# EasyEDA Pro project 辅助电源.epro, board 3V3/5V
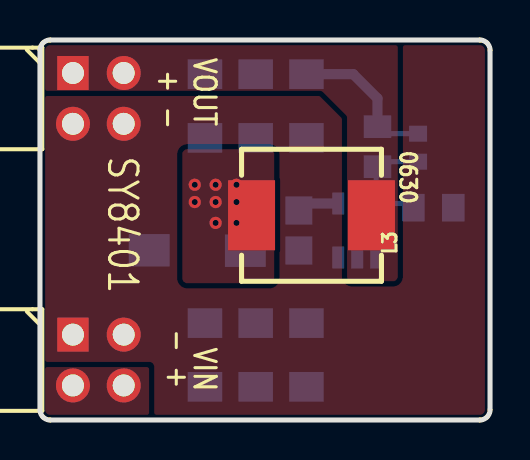
[diagram p11: board, top side]
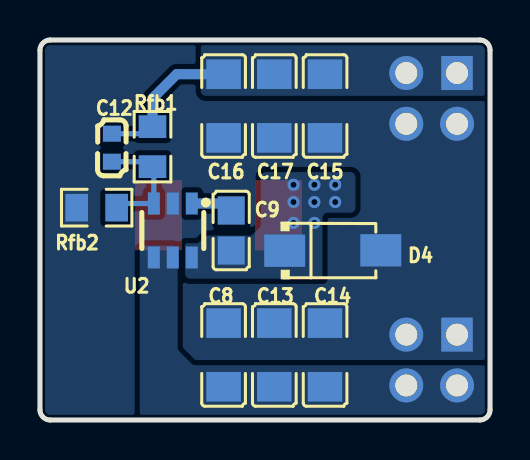
[diagram p12: board, bottom side, seen from below]

Outline 22.52 x 19 mm; copper layers: Top Layer, Bottom Layer. Coordinates in mm from the lower left corner of the outline.
Outline path: 0,18.49 0,0.51 arc(0.15,0.15) 0.51,0 22.01,0 arc(22.37,0.15) 22.52,0.51 22.52,18.49 arc(22.37,18.85) 22.01,19 0.51,19 arc(0.15,18.85) 0,18.49
Stack: Top Layer 0.035mm / Dielectric1 1.51mm FR4 er 4.5 / Bottom Layer 0.035mm

## Design rules (mm)
spacing copperThickness1oz (default): track to track 0.102, other pairs 0.152 to 0.3
spacing copperThickness2oz: track to track 0.203, other pairs 0.152 to 0.3
spacing Plane_innerPlane: track to track 0.102, other pairs 0.152 to 0.3
spacing Copper_copperRegion: track to track 0.102, other pairs 0.152 to 0.3
track width copperThickness1oz (default): min 0.127, default 0.254, max 2.54
track width copperThickness2oz: min 0.203, default 0.254, max 2.54
differential pair differentialPair (default): width min 0.127, default 0.254, max 2.54; gap min 0.152, default 0.152
pour e23 uses Copper_copperRegion
pour e25 uses Copper_copperRegion
pour e27 uses Copper_copperRegion
pour e29 uses Copper_copperRegion
pour e31 uses Copper_copperRegion
pour e33 uses Copper_copperRegion
pour e35 uses Copper_copperRegion
pour e37 uses Copper_copperRegion

## Placement (name value [footprint] x y rotation side)
C8  100nF  [C1206]  13.34 3.25 270 bottom
C9  100nF  [C0805]  12.95 9.47 90 bottom
C12  22pF  [C0603]  18.92 13.61 90 bottom
C13  10uF  [C1206]  10.79 3.25 270 bottom
C14  47uF  [C1206]  8.25 3.25 270 bottom
C15  100nF  [C1206]  8.25 15.7 90 bottom
C16  10uF  [C1206]  13.34 15.7 90 bottom
C17  10uF  [C1206]  10.79 15.7 90 bottom
D4  SS510  [SMA_L4.3-W2.6-LS5.0-RD]  7.87 8.47 180 bottom
J1  HX PZ2.54-2x2P WC-A  [HDR-TH_4P-P2.54-H-M-R2-C2-S2.54-W10.0]  2.92 3 270 top
J2  HX PZ2.54-2x2P WC-A  [HDR-TH_4P-P2.54-H-M-R2-C2-S2.54-W10.0]  2.92 16.08 270 top
L3  10uH  [IND-SMD_L7.3-W6.8]  13.59 10.24 0 top
Rfb1  220K  [R0805]  16.89 13.67 90 bottom
Rfb2  30K  [R0805]  19.69 10.62 180 bottom
U2  SY8401ABC  [SOT-23-6_L2.9-W1.6-P0.95-LS2.8-BR]  15.88 9.47 90 bottom

## Footprints (pads in the part's own frame, mm; a bottom-side part is the same pattern mirrored in y, then rotated)
C0603
  rect 0.8x0.9 smd: 1(-0.7,0) 2(0.7,0)
C0805
  rect 1.41x1.35 smd: 1(-1,0) 2(1,0)
C1206
  rect 1.485x1.728 smd: 1(-1.593,0) 2(1.593,0)
HDR-TH_4P-P2.54-H-M-R2-C2-S2.54-W10.0
  rect 1.7x1.575 hole 1.1: 1(-1.27,-1.27)
  round 1.7 hole 1.1: 2(-1.27,1.27) 3(1.27,-1.27) 4(1.27,1.27)
IND-SMD_L7.3-W6.8
  rect 2.35x3.5 smd: 1(-3,0) 2(3,0)
R0805
  rect 1.133x1.377 smd: 1(-1,0) 2(1,0)
SMA_L4.3-W2.6-LS5.0-RD
  rect 2.046x1.62 smd: 1(-2.404,-0.009) 2(2.404,0.009)
SOT-23-6_L2.9-W1.6-P0.95-LS2.8-BR
  rect 1.1x0.6 smd: 1(1.35,-0.95) 2(1.35,0) 3(1.35,0.95) 4(-1.35,0.95) 5(-1.35,0) 6(-1.35,-0.95)

## Nets
As in the schematic.

## Via types
v1: diameter 0.61, hole 0.305, Top Layer to Bottom Layer, 8 vias

## Routing (per net, layer and track width the routed paths; a pad name or vN(x,y) marks a point on that pad's centre or on a via; arc(x,y) is an arc through that point)
VOUT: length 7.6
  Bottom Layer w0.254: Rfb1.2 17.24,14.31 C12.2
  Bottom Layer w0.508: C16.2 15.68,17.29 16.89,16.08 Rfb1.2
$1N562: length 5.9
  Bottom Layer w0.254: C12.1 17.14,12.91 Rfb1.1 16.82,12.6 U2.3 18.48,10.82 Rfb2.2
$1N567: length 2.1
  Bottom Layer w0.508: U2.1 13.3,10.82 C9.2
$1N1221:
  vias: v1(7.75,11.76) v1(7.75,10.9) v1(8.79,11.76) v1(8.79,10.9) v1(8.79,9.85) v1(9.83,11.76) v1(9.83,10.9) v1(9.83,9.85)

## Copper pours and planes (outline as drawn; the poured copper is in the pictures)
GND on Top Layer: -0.89,20.65 22.99,20.65 22.99,-0.69 -0.89,-0.69
GND on Bottom Layer: -1.78,21.67 25.27,21.67 25.27,-1.7 -1.78,-1.7
VIN on Top Layer: 5.46,2.65 -1.14,2.65 -1.14,-0.56 -0.51,-1.19 5.46,-1.19
VIN on Bottom Layer: 15.89,8.72 15.71,8.64 15.63,8.46 15.63,3.62 15.61,3.53 15.56,3.44 14.93,2.82 14.85,2.76 14.75,2.74 -0.38,2.74 -0.56,2.67 -0.63,2.49 -0.63,-1.45 -0.51,-1.57 17.4,-1.57 17.53,-1.7 17.53,8.46 17.45,8.64 17.27,8.72
$1N1221 on Top Layer: 11.73,7.09 11.65,6.91 11.47,6.84 7.38,6.84 7.2,6.91 7.13,7.09 7.13,13.28 7.2,13.46 7.38,13.54 11.47,13.54 11.65,13.46 11.73,13.28
$1N1221 on Bottom Layer: 8.38,10.11 8.31,10.29 8.13,10.36 6.99,10.36 6.81,10.44 6.73,10.62 6.73,12.14 6.81,12.32 6.99,12.4 11.22,12.4 11.4,12.32 11.48,12.14 11.48,9.79 11.5,9.69 11.55,9.61 11.86,9.3 11.95,9.24 12.04,9.22 14.12,9.22 14.22,9.2 14.3,9.15 14.53,8.91 14.61,8.86 14.71,8.84 15.24,8.84 15.26,8.82 15.26,7.32 15.19,7.14 15.01,7.06 8.38,7.06
VOUT on Top Layer: 17.91,20.27 17.91,7.19 17.83,7.01 17.65,6.93 15.62,6.93 15.44,7.01 15.37,7.19 15.37,15.08 15.35,15.18 15.29,15.26 14.17,16.39 14.09,16.44 13.99,16.46 -0.89,16.46 -1.07,16.53 -1.14,16.71 -1.14,20.04 -1.12,20.14 -1.07,20.22 -0.96,20.32 -0.88,20.38 -0.78,20.4 17.78,20.4
VOUT on Bottom Layer: 14.48,16.46 14.4,16.28 14.22,16.21 -1.78,16.21 -1.96,16.28 -2.03,16.46 -2.03,21.31 -2.01,21.41 -1.96,21.49 -0.96,22.48 -0.88,22.54 -0.78,22.56 14.12,22.56 14.22,22.58 14.3,22.63 14.48,22.81

## Text on the board
Top Silkscreen Layer: 0630 | + - | VOUT | VIN | SY8401
